# Altium schematic sheet Power.SchDoc
size A4; SheetNumber: 2; SheetTotal: 3; SPICEModelCacheLUYUMUGJ: <root> / <DocumentId>LUYUMUGJ</DocumentId> / </root>
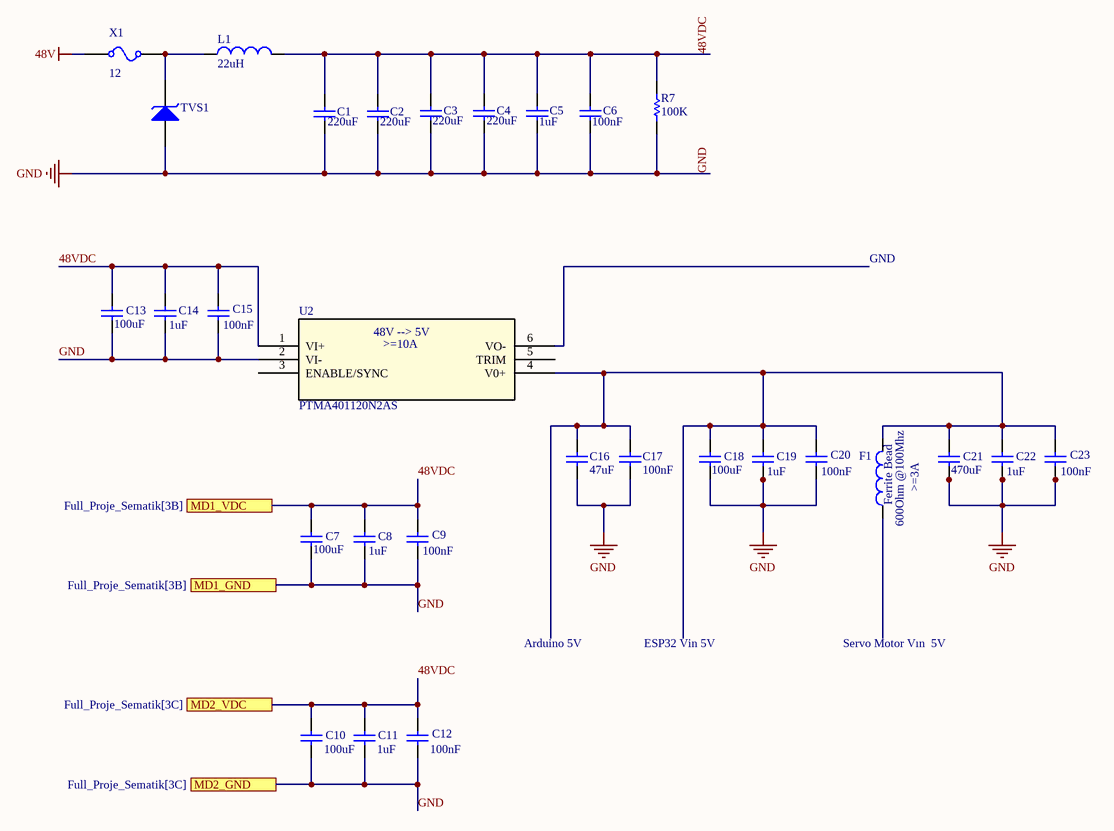
[diagram p0: Power.SchDoc]

## Parts
C1  value 220uF  (hidden comment: Capacitor)
C2  value 220uF  (hidden comment: Capacitor)
C3  value 220uF  (hidden comment: Capacitor)
C4  value 220uF  (hidden comment: Capacitor)
C5  value 1uF  (hidden comment: Capacitor)
C6  value 100nF  (hidden comment: Capacitor)
C7  value 100uF  (hidden comment: Capacitor)
C8  value 1uF  (hidden comment: Capacitor)
C9  value 100nF  (hidden comment: Capacitor)
C10  value 100uF  (hidden comment: Capacitor)
C11  value 1uF  (hidden comment: Capacitor)
C12  value 100nF  (hidden comment: Capacitor)
C13  value 100uF  (hidden comment: Capacitor)
C14  value 1uF  (hidden comment: Capacitor)
C15  value 100nF  (hidden comment: Capacitor)
C16  value 47uF  (hidden comment: Capacitor)
C17  value 100nF  (hidden comment: Capacitor)
C18  value 100uF  (hidden comment: Capacitor)
C19  value 1uF  (hidden comment: Capacitor)
C20  value 100nF  (hidden comment: Capacitor)
C21  value 470uF  (hidden comment: Capacitor)
C22  value 1uF  (hidden comment: Capacitor)
C23  value 100nF  (hidden comment: Capacitor)
F1  Ferrite Bead
L1  value 22uH  (hidden comment: Inductor)
R7  value 100K  (hidden comment: Resistor)
TVS1  Suppressor Single  (value not drawn)
U2  PTMA401120N2AS  [EET6]
X1  CURRENT: 12  (hidden comment: Fuse)

## Ports
MD1_GND (see Full_Proje_Sematik[3B]), MD1_VDC (see Full_Proje_Sematik[3B]), MD2_GND (see Full_Proje_Sematik[3C]), MD2_VDC (see Full_Proje_Sematik[3C])

## Nets
48V: X1.1
GND: C1.2 C2.1 C3.1 C4.1 C5.1 C6.1 C7.2 C8.2 C9.2 C10.2 C11.2 C12.2 C13.2 C14.2 C15.2 C16.2 C17.2 C18.2 C19.2 C20.2 C21.2 C22.2 C23.2 R7.1 TVS1.1(A) U2.2(VI-) ; port MD1_GND, port MD2_GND
48VDC: C1.1 C2.2 C3.2 C4.2 C5.2 C6.2 C7.1 C8.1 C9.1 C10.1 C11.1 C12.1 C13.1 C14.1 C15.1 L1.2 R7.2 U2.1(VI+) ; port MD1_VDC, port MD2_VDC
NetC16_1: C16.1 C17.1 C18.1 C19.1 C20.1 C21.1 C22.1 C23.1 F1.2 U2.4(V0+)
NetL1_1: L1.1 TVS1.2(K) X1.2

Not connected (* = marked no-connect by the designer): F1 1; U2 3(ENABLE/SYNC) 5(TRIM) 6(VO-)

## Notes on the sheet
- GND
- (near U2) 48V --> 5V
- (near U2) >=10A
- >=3A
- (near F1) 600Ohm @100Mhz
- Arduino 5V
- ESP32 Vin 5V
- Servo Motor Vın  5V

## Library data of the parts
C1-C4 C7 C10 C13 C16 C18 C21 = Capacitor: Bulk Capacitor 63V; SimulationGenericComponent: True
C5 C6 C8 C9 C11 C12 C14 C15 C17 C19 C20 C22 C23 = Capacitor: Seramic Capacitor 100V; SimulationGenericComponent: True
F1 = Inductor: Ferrite Bead 600Ohm @100Mhz; SimulationGenericComponent: True
L1 = Inductor: Inductor  >=10A; SimulationGenericComponent: True
R7 = Resistor: TC1: 0; SimulationGenericComponent: True; TC2: 0
TVS1 = Suppressor Single: 58V(VRWM) / 600–1500W / Unidirectional / SMBJ58A; AF: 1; BV: 0; BV_MAX: 1e99; EG: 1.11; FC: 0.5; IBV: 0.001; IS: 1e-14; MJSW: 0.33; NTUN: 30; TNOM: 27; XTI: 3; SimulationGenericComponent: True; CJO: 0; CJP: 0; CTA: 0; CTP: 0; FCS: 0.5; FV_MAX: 1e99; IKF: 0; IKR: 0; ISR: 1e-14; JSW: 0; JTUN: 0; JTUNSW: 0; KEG: 1; KF: 0; LEVEL: 1; N: 1; NBV: 1; NR: 1; NS: 1; PHP: 1; RS: 0; TCV: 0; TLEV: 0; TLEVC: 0; TM1: 0; TM2: 0; TPB: 0; TPHP: 0; TRS: 0; TRS2: 0; TT: 0; TTT1: 0; TTT2: 0; VJ: 1; XTITUN: 3
U2 = PTMA401120N2AS: No Description Available; Manufacturer_Name: Texas Instruments; Copyright: Copyright (C) 2026 Ultra Librarian. All rights reserved.; Manufacturer_Part_Number: PTMA401120N2AS; RefDes: RefDes; Type: Type
X1 = Fuse: 12A SLOW BLOW FUSE; RESISTANCE: 1m; SimulationGenericComponent: True